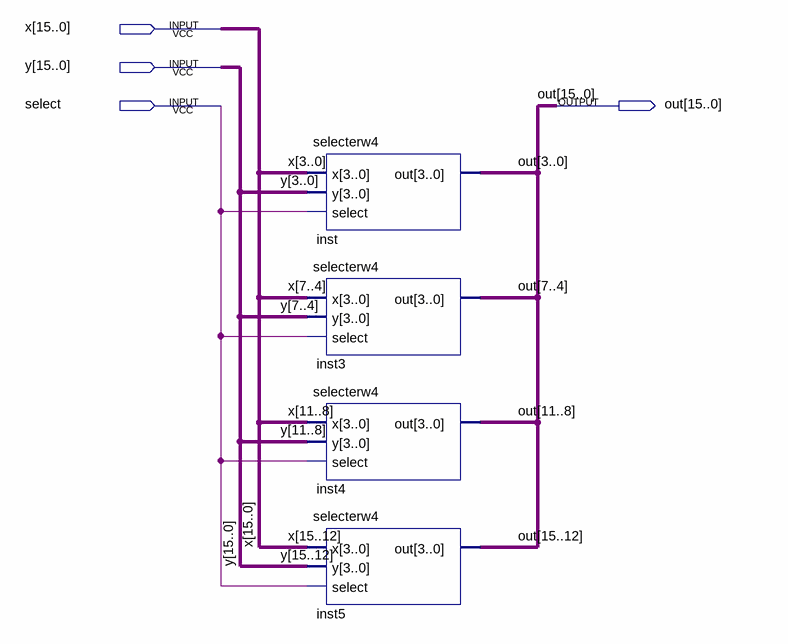
[diagram p0: schematic sheet]
// Quartus schematic selecterw16.bdf as structural Verilog: 4 symbols, 4 pins
module selecterw16 (
  input  [15:0] x,
  input  [15:0] y,
  input  select,
  output [15:0] out
);

  selecterw4 inst (.x(x[3:0]), .y(y[3:0]), .select(select), .out(out[3:0]));
  selecterw4 inst3 (.x(x[7:4]), .y(y[7:4]), .select(select), .out(out[7:4]));
  selecterw4 inst4 (.x(x[11:8]), .y(y[11:8]), .select(select), .out(out[11:8]));
  selecterw4 inst5 (.x(x[15:12]), .y(y[15:12]), .select(select), .out(out[15:12]));
endmodule
